# Altium project Lamps_board.PrjPcb
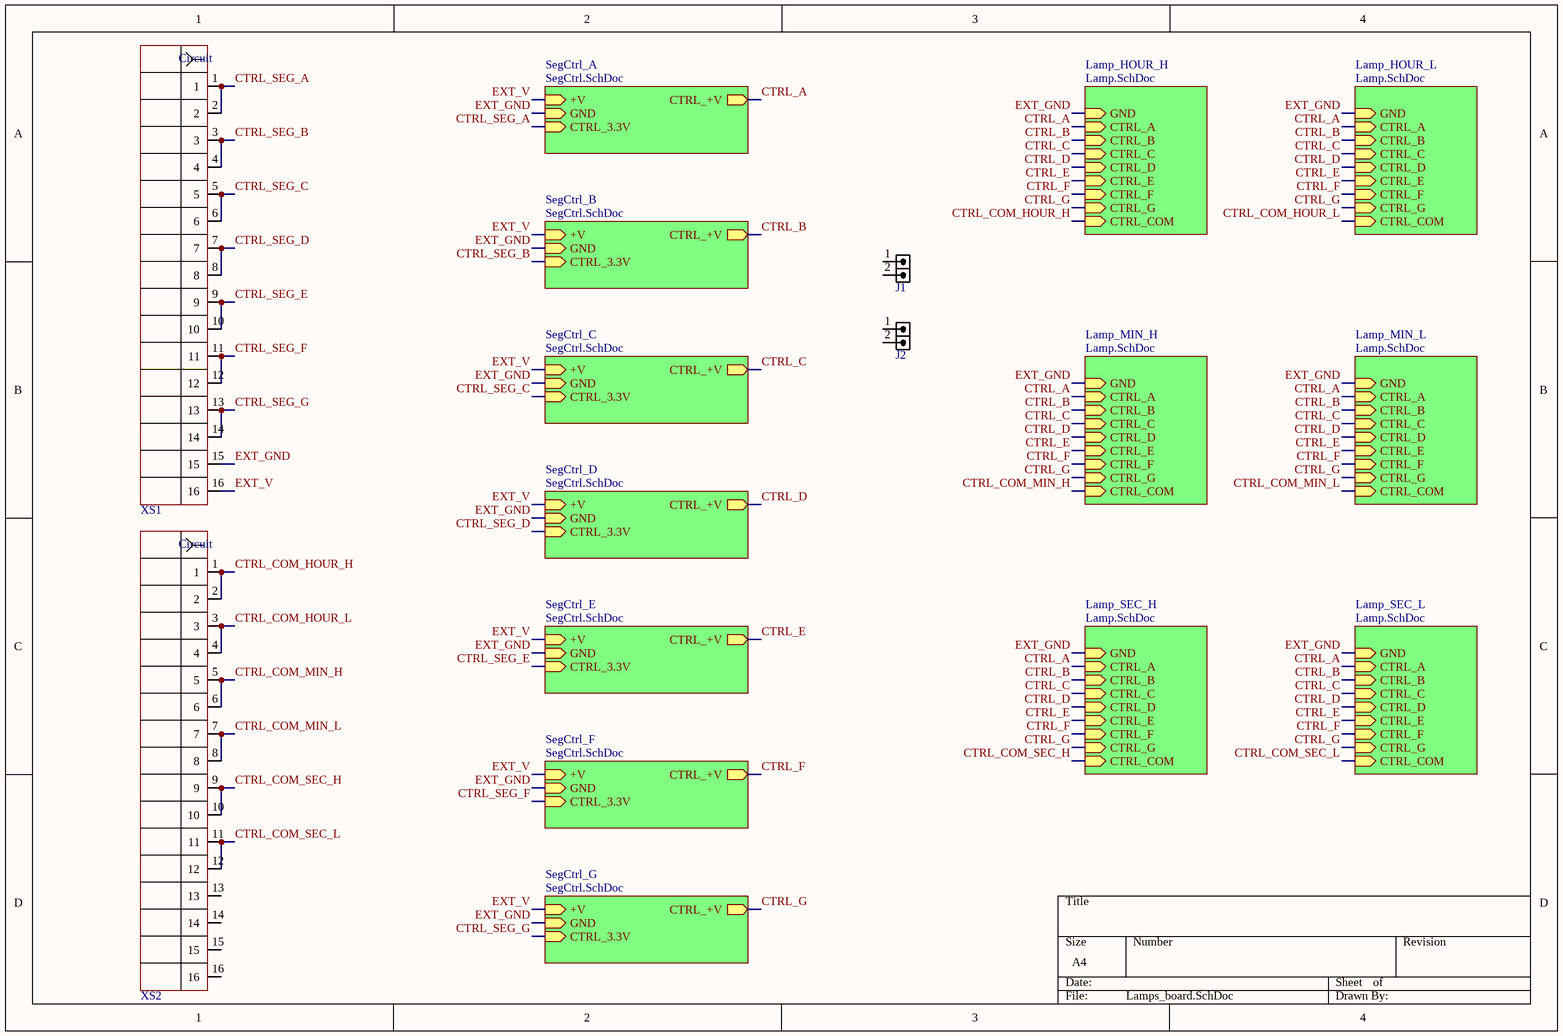
[diagram p0: Lamps_board.SchDoc]
3 sheets, 111 parts. Net scope: hierarchical (ports join the sheet entries above them; power ports are global).
Board file: Lamps_board.PcbDoc
Sheets:
  Lamps_board.SchDoc
    Lamp_HOUR_H = Lamp.SchDoc
    Lamp_HOUR_L = Lamp.SchDoc
    Lamp_MIN_H = Lamp.SchDoc
    Lamp_SEC_L = Lamp.SchDoc
    Lamp_MIN_L = Lamp.SchDoc
    Lamp_SEC_H = Lamp.SchDoc
    SegCtrl_A = SegCtrl.SchDoc
    SegCtrl_B = SegCtrl.SchDoc
    SegCtrl_C = SegCtrl.SchDoc
    SegCtrl_D = SegCtrl.SchDoc
    SegCtrl_E = SegCtrl.SchDoc
    SegCtrl_F = SegCtrl.SchDoc
    SegCtrl_G = SegCtrl.SchDoc

## Sheet Lamps_board.SchDoc
size A4

### Parts
J1  HDRM2  [HDR_M_1X2]  (value not drawn)
J2  HDRM2  [HDR_M_1X2]  (value not drawn)
XS1  PBD-16  [PBD-16-3D]  (value not drawn)
XS2  PBD-16  [PBD-16-3D]  (value not drawn)

### Sub-sheets
Lamp_HOUR_H = Lamp.SchDoc: GND (in), CTRL_A (in), CTRL_B (in), CTRL_C (in), CTRL_D (in), CTRL_E (in), CTRL_F (in), CTRL_G (in), CTRL_COM (in)
Lamp_HOUR_L = Lamp.SchDoc: GND (in), CTRL_A (in), CTRL_B (in), CTRL_C (in), CTRL_D (in), CTRL_E (in), CTRL_F (in), CTRL_G (in), CTRL_COM (in)
Lamp_MIN_H = Lamp.SchDoc: GND (in), CTRL_A (in), CTRL_B (in), CTRL_C (in), CTRL_D (in), CTRL_E (in), CTRL_F (in), CTRL_G (in), CTRL_COM (in)
Lamp_MIN_L = Lamp.SchDoc: GND (in), CTRL_A (in), CTRL_B (in), CTRL_C (in), CTRL_D (in), CTRL_E (in), CTRL_F (in), CTRL_G (in), CTRL_COM (in)
Lamp_SEC_H = Lamp.SchDoc: GND (in), CTRL_A (in), CTRL_B (in), CTRL_C (in), CTRL_D (in), CTRL_E (in), CTRL_F (in), CTRL_G (in), CTRL_COM (in)
Lamp_SEC_L = Lamp.SchDoc: GND (in), CTRL_A (in), CTRL_B (in), CTRL_C (in), CTRL_D (in), CTRL_E (in), CTRL_F (in), CTRL_G (in), CTRL_COM (in)
SegCtrl_A = SegCtrl.SchDoc: +V (in), GND (in), CTRL_3.3V (in), CTRL_+V (out)
SegCtrl_B = SegCtrl.SchDoc: +V (in), GND (in), CTRL_3.3V (in), CTRL_+V (out)
SegCtrl_C = SegCtrl.SchDoc: +V (in), GND (in), CTRL_3.3V (in), CTRL_+V (out)
SegCtrl_D = SegCtrl.SchDoc: +V (in), GND (in), CTRL_3.3V (in), CTRL_+V (out)
SegCtrl_E = SegCtrl.SchDoc: +V (in), GND (in), CTRL_3.3V (in), CTRL_+V (out)
SegCtrl_F = SegCtrl.SchDoc: +V (in), GND (in), CTRL_3.3V (in), CTRL_+V (out)
SegCtrl_G = SegCtrl.SchDoc: +V (in), GND (in), CTRL_3.3V (in), CTRL_+V (out)

### Nets
CTRL_A: sheet Lamp_HOUR_H/CTRL_A, sheet Lamp_HOUR_L/CTRL_A, sheet Lamp_MIN_H/CTRL_A, sheet Lamp_SEC_L/CTRL_A, sheet Lamp_MIN_L/CTRL_A, sheet Lamp_SEC_H/CTRL_A, sheet SegCtrl_A/CTRL_+V
CTRL_B: sheet Lamp_HOUR_H/CTRL_B, sheet Lamp_HOUR_L/CTRL_B, sheet Lamp_MIN_H/CTRL_B, sheet Lamp_SEC_L/CTRL_B, sheet Lamp_MIN_L/CTRL_B, sheet Lamp_SEC_H/CTRL_B, sheet SegCtrl_B/CTRL_+V
CTRL_C: sheet Lamp_HOUR_H/CTRL_C, sheet Lamp_HOUR_L/CTRL_C, sheet Lamp_MIN_H/CTRL_C, sheet Lamp_SEC_L/CTRL_C, sheet Lamp_MIN_L/CTRL_C, sheet Lamp_SEC_H/CTRL_C, sheet SegCtrl_C/CTRL_+V
CTRL_COM_HOUR_H: XS2.1 XS2.2 ; sheet Lamp_HOUR_H/CTRL_COM
CTRL_COM_HOUR_L: XS2.3 XS2.4 ; sheet Lamp_HOUR_L/CTRL_COM
CTRL_COM_MIN_H: XS2.5 XS2.6 ; sheet Lamp_MIN_H/CTRL_COM
CTRL_COM_MIN_L: XS2.7 XS2.8 ; sheet Lamp_MIN_L/CTRL_COM
CTRL_COM_SEC_H: XS2.9 XS2.10 ; sheet Lamp_SEC_H/CTRL_COM
CTRL_COM_SEC_L: XS2.11 XS2.12 ; sheet Lamp_SEC_L/CTRL_COM
CTRL_D: sheet Lamp_HOUR_H/CTRL_D, sheet Lamp_HOUR_L/CTRL_D, sheet Lamp_MIN_H/CTRL_D, sheet Lamp_SEC_L/CTRL_D, sheet Lamp_MIN_L/CTRL_D, sheet Lamp_SEC_H/CTRL_D, sheet SegCtrl_D/CTRL_+V
CTRL_E: sheet Lamp_HOUR_H/CTRL_E, sheet Lamp_HOUR_L/CTRL_E, sheet Lamp_MIN_H/CTRL_E, sheet Lamp_SEC_L/CTRL_E, sheet Lamp_MIN_L/CTRL_E, sheet Lamp_SEC_H/CTRL_E, sheet SegCtrl_E/CTRL_+V
CTRL_F: sheet Lamp_HOUR_H/CTRL_F, sheet Lamp_HOUR_L/CTRL_F, sheet Lamp_MIN_H/CTRL_F, sheet Lamp_SEC_L/CTRL_F, sheet Lamp_MIN_L/CTRL_F, sheet Lamp_SEC_H/CTRL_F, sheet SegCtrl_F/CTRL_+V
CTRL_G: sheet Lamp_HOUR_H/CTRL_G, sheet Lamp_HOUR_L/CTRL_G, sheet Lamp_MIN_H/CTRL_G, sheet Lamp_SEC_L/CTRL_G, sheet Lamp_MIN_L/CTRL_G, sheet Lamp_SEC_H/CTRL_G, sheet SegCtrl_G/CTRL_+V
CTRL_SEG_A: XS1.1 XS1.2 ; sheet SegCtrl_A/CTRL_3.3V
CTRL_SEG_B: XS1.3 XS1.4 ; sheet SegCtrl_B/CTRL_3.3V
CTRL_SEG_C: XS1.5 XS1.6 ; sheet SegCtrl_C/CTRL_3.3V
CTRL_SEG_D: XS1.7 XS1.8 ; sheet SegCtrl_D/CTRL_3.3V
CTRL_SEG_E: XS1.9 XS1.10 ; sheet SegCtrl_E/CTRL_3.3V
CTRL_SEG_F: XS1.11 XS1.12 ; sheet SegCtrl_F/CTRL_3.3V
CTRL_SEG_G: XS1.13 XS1.14 ; sheet SegCtrl_G/CTRL_3.3V
EXT_GND: XS1.15 ; sheet Lamp_HOUR_H/GND, sheet Lamp_HOUR_L/GND, sheet Lamp_MIN_H/GND, sheet Lamp_SEC_L/GND, sheet Lamp_MIN_L/GND, sheet Lamp_SEC_H/GND, sheet SegCtrl_A/GND, sheet SegCtrl_B/GND, sheet SegCtrl_C/GND, sheet SegCtrl_D/GND, sheet SegCtrl_E/GND, sheet SegCtrl_F/GND, sheet SegCtrl_G/GND
EXT_V: XS1.16 ; sheet SegCtrl_A/+V, sheet SegCtrl_B/+V, sheet SegCtrl_C/+V, sheet SegCtrl_D/+V, sheet SegCtrl_E/+V, sheet SegCtrl_F/+V, sheet SegCtrl_G/+V

Not connected (* = marked no-connect by the designer): J1 1 2; J2 1 2; XS2 13 14 15 16

### Notes on the sheet
- (in symbol SH2-16G) Circuit

### Library data of the parts
J1 J2 = HDR_M_1X2: CONN, HEADER, Male, pitch: 2.54mm, 2POS; VALUE: HDRM2
XS1 XS2 = SH2-16G: CONN RCPT 16POS 0.1 GOLD PCB; System: Connector; Part Number: SH2-16G; Manufacturer Part Number: SH2-16G; Digi-Key Part Number: ED3071-ND; Price$: 0.20250; Package: Socket 16POS 2.54mm; HelpURL: https://www.digikey.com/en/products/detail/on-shore-technology-inc/SH2-16G/2721215

## Sheet Lamp.SchDoc
size A4
Used 6 times, as channels Lamp_HOUR_H, Lamp_HOUR_L, Lamp_MIN_H, Lamp_SEC_L, Lamp_MIN_L, Lamp_SEC_H. Parts and nets are listed once, with the designators drawn on the sheet.
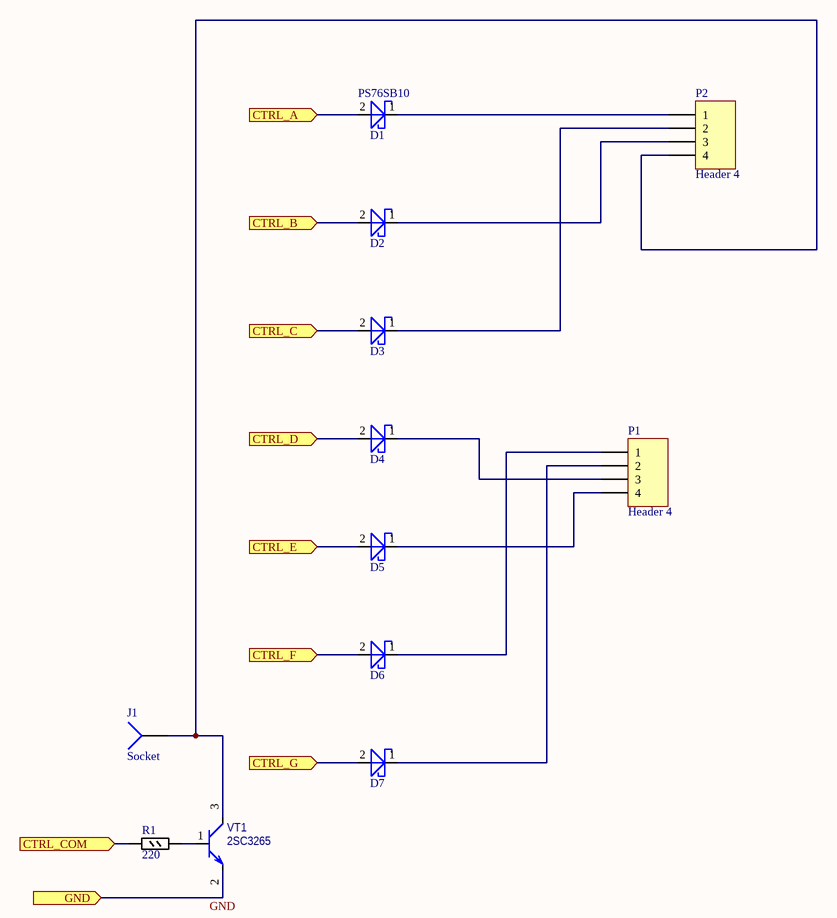
[diagram p1: Lamp.SchDoc]

### Parts
D1  PS76SB10  [SOD2512X115N]
D2  1A 20V  [SOD2512X115N]  (value not drawn)
D3  1A 20V  [SOD2512X115N]  (value not drawn)
D4  1A 20V  [SOD2512X115N]  (value not drawn)
D5  1A 20V  [SOD2512X115N]  (value not drawn)
D6  1A 20V  [SOD2512X115N]  (value not drawn)
D7  1A 20V  [SOD2512X115N]  (value not drawn)
J1  Socket  [PIN1]
P1  Header 4  [HDR1X4]
P2  Header 4  [HDR1X4]
R1  220  [RESC2012(0805)N]
VT1  2SC3265  [SOT23-3N]

### Ports
CTRL_A (in), CTRL_B (in), CTRL_C (in), CTRL_COM (in), CTRL_D (in), CTRL_E (in), CTRL_F (in), CTRL_G (in), GND (in)

### Nets
CTRL_A: D1.2(A) ; port CTRL_A
CTRL_B: D2.2(A) ; port CTRL_B
CTRL_C: D3.2(A) ; port CTRL_C
CTRL_COM: R1.1 ; port CTRL_COM
CTRL_D: D4.2(A) ; port CTRL_D
CTRL_E: D5.2(A) ; port CTRL_E
CTRL_F: D6.2(A) ; port CTRL_F
CTRL_G: D7.2(A) ; port CTRL_G
GND: VT1.2(E) ; port GND
NetD1_1: D1.1(K) P2.1
NetD2_1: D2.1(K) P2.3
NetD3_1: D3.1(K) P2.2
NetD4_1: D4.1(K) P1.3
NetD5_1: D5.1(K) P1.4
NetD6_1: D6.1(K) P1.1
NetD7_1: D7.1(K) P1.2
NetJ1_1: J1.1 P2.4 VT1.3(C)
NetR1_2: R1.2 VT1.1(B)

### Channels
Lamp_HOUR_H: designators end in _Lamp_HOUR_H; ports CTRL_A=CTRL_A CTRL_B=CTRL_B CTRL_C=CTRL_C CTRL_COM=CTRL_COM_HOUR_H CTRL_D=CTRL_D CTRL_E=CTRL_E CTRL_F=CTRL_F CTRL_G=CTRL_G GND=EXT_GND
Lamp_HOUR_L: designators end in _Lamp_HOUR_L; ports CTRL_A=CTRL_A CTRL_B=CTRL_B CTRL_C=CTRL_C CTRL_COM=CTRL_COM_HOUR_L CTRL_D=CTRL_D CTRL_E=CTRL_E CTRL_F=CTRL_F CTRL_G=CTRL_G GND=EXT_GND
Lamp_MIN_H: designators end in _Lamp_MIN_H; ports CTRL_A=CTRL_A CTRL_B=CTRL_B CTRL_C=CTRL_C CTRL_COM=CTRL_COM_MIN_H CTRL_D=CTRL_D CTRL_E=CTRL_E CTRL_F=CTRL_F CTRL_G=CTRL_G GND=EXT_GND
Lamp_SEC_L: designators end in _Lamp_SEC_L; ports CTRL_A=CTRL_A CTRL_B=CTRL_B CTRL_C=CTRL_C CTRL_COM=CTRL_COM_SEC_L CTRL_D=CTRL_D CTRL_E=CTRL_E CTRL_F=CTRL_F CTRL_G=CTRL_G GND=EXT_GND
Lamp_MIN_L: designators end in _Lamp_MIN_L; ports CTRL_A=CTRL_A CTRL_B=CTRL_B CTRL_C=CTRL_C CTRL_COM=CTRL_COM_MIN_L CTRL_D=CTRL_D CTRL_E=CTRL_E CTRL_F=CTRL_F CTRL_G=CTRL_G GND=EXT_GND
Lamp_SEC_H: designators end in _Lamp_SEC_H; ports CTRL_A=CTRL_A CTRL_B=CTRL_B CTRL_C=CTRL_C CTRL_COM=CTRL_COM_SEC_H CTRL_D=CTRL_D CTRL_E=CTRL_E CTRL_F=CTRL_F CTRL_G=CTRL_G GND=EXT_GND

### Library data of the parts
D1-D7 = B5817WS: DIODE SCHOTTKY 20V 1A SOD323; Part Number: B5817WS; HelpURL: https://www.digikey.com/en/products/detail/yangzhou-yangjie-electronic-technology-co-ltd/B5817WS/13911879; Digi-Key Part Number: 3191-B5817WSCT-ND; Manufacturer Part Number: B5817WS; Package: SOD-323
P1 P2 = Header 4: Header, 4-Pin; LatestRevisionDate: 17-Jul-2002; LatestRevisionNote: Re-released for DXP Platform.; Publisher: Altium Limited
R1 = RESC2012(0805): Part Number: RESC2012(0805); Package: 0805
VT1 = BC848: Part Number: BC848; HelpURL: http://www.nxp.com/documents/data_sheet/BC848_SER.pdf
J1 = Socket: LatestRevisionDate: 17-Jul-2002; LatestRevisionNote: Re-released for DXP Platform.; Publisher: Altium Limited

## Sheet SegCtrl.SchDoc
size A4
Used 7 times, as channels SegCtrl_A, SegCtrl_B, SegCtrl_C, SegCtrl_D, SegCtrl_E, SegCtrl_F, SegCtrl_G. Parts and nets are listed once, with the designators drawn on the sheet.
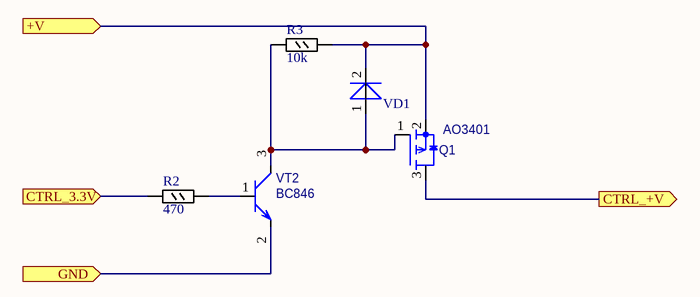
[diagram p2: SegCtrl.SchDoc]

### Parts
Q1  AO3401  [SOT23-3N]
R2  470  [RESC2012(0805)N]
R3  10k  [RESC2012(0805)N]
VD1  1A 40V  [SMA]  (value not drawn)
VT2  BC846  [SOT23-3N]

### Ports
+V (in), CTRL_3.3V (in), CTRL_+V (out), GND (in)

### Nets
+V: Q1.2(S) R3.2 VD1.2 ; port +V
CTRL_3.3V: R2.1 ; port CTRL_3.3V
CTRL_+V: Q1.3(D) ; port CTRL_+V
GND: VT2.2(E) ; port GND
NetQ1_1: Q1.1(G) R3.1 VD1.1 VT2.3(C)
NetR2_2: R2.2 VT2.1(B)

### Channels
SegCtrl_A: designators end in _SegCtrl_A; ports +V=EXT_V CTRL_3.3V=CTRL_SEG_A CTRL_+V=CTRL_A GND=EXT_GND
SegCtrl_B: designators end in _SegCtrl_B; ports +V=EXT_V CTRL_3.3V=CTRL_SEG_B CTRL_+V=CTRL_B GND=EXT_GND
SegCtrl_C: designators end in _SegCtrl_C; ports +V=EXT_V CTRL_3.3V=CTRL_SEG_C CTRL_+V=CTRL_C GND=EXT_GND
SegCtrl_D: designators end in _SegCtrl_D; ports +V=EXT_V CTRL_3.3V=CTRL_SEG_D CTRL_+V=CTRL_D GND=EXT_GND
SegCtrl_E: designators end in _SegCtrl_E; ports +V=EXT_V CTRL_3.3V=CTRL_SEG_E CTRL_+V=CTRL_E GND=EXT_GND
SegCtrl_F: designators end in _SegCtrl_F; ports +V=EXT_V CTRL_3.3V=CTRL_SEG_F CTRL_+V=CTRL_F GND=EXT_GND
SegCtrl_G: designators end in _SegCtrl_G; ports +V=EXT_V CTRL_3.3V=CTRL_SEG_G CTRL_+V=CTRL_G GND=EXT_GND

### Library data of the parts
Q1 = DMP10H4D2S-7: MOSFET P-CH 100V 270MA SOT23; Part Number: DMP10H4D2S-7; Package: DMP10H4D2S-7
R2 R3 = RESC2012(0805): Part Number: RESC2012(0805); Package: 0805
VD1 = SS14: Диод Шоттки 1A 40В [SMA / DO-214AC]; Part Number: SS14; HelpURL: http://www.vishay.com/docs/88746/ss12.pdf
VT2 = BC848: Part Number: BC848; HelpURL: http://www.nxp.com/documents/data_sheet/BC848_SER.pdf

## Nets that join several sheets
CTRL_A: Lamp_HOUR_H (D1_Lamp_HOUR_H.2), Lamp_HOUR_L (D1_Lamp_HOUR_L.2), Lamp_MIN_H (D1_Lamp_MIN_H.2), Lamp_SEC_L (D1_Lamp_SEC_L.2), Lamp_MIN_L (D1_Lamp_MIN_L.2), Lamp_SEC_H (D1_Lamp_SEC_H.2), SegCtrl_A (Q1_SegCtrl_A.3)
CTRL_B: Lamp_HOUR_H (D2_Lamp_HOUR_H.2), Lamp_HOUR_L (D2_Lamp_HOUR_L.2), Lamp_MIN_H (D2_Lamp_MIN_H.2), Lamp_SEC_L (D2_Lamp_SEC_L.2), Lamp_MIN_L (D2_Lamp_MIN_L.2), Lamp_SEC_H (D2_Lamp_SEC_H.2), SegCtrl_B (Q1_SegCtrl_B.3)
CTRL_C: Lamp_HOUR_H (D3_Lamp_HOUR_H.2), Lamp_HOUR_L (D3_Lamp_HOUR_L.2), Lamp_MIN_H (D3_Lamp_MIN_H.2), Lamp_SEC_L (D3_Lamp_SEC_L.2), Lamp_MIN_L (D3_Lamp_MIN_L.2), Lamp_SEC_H (D3_Lamp_SEC_H.2), SegCtrl_C (Q1_SegCtrl_C.3)
CTRL_COM_HOUR_H: Lamps_board (XS2.1 XS2.2), Lamp_HOUR_H (R1_Lamp_HOUR_H.1)
CTRL_COM_HOUR_L: Lamps_board (XS2.3 XS2.4), Lamp_HOUR_L (R1_Lamp_HOUR_L.1)
CTRL_COM_MIN_H: Lamps_board (XS2.5 XS2.6), Lamp_MIN_H (R1_Lamp_MIN_H.1)
CTRL_COM_MIN_L: Lamps_board (XS2.7 XS2.8), Lamp_MIN_L (R1_Lamp_MIN_L.1)
CTRL_COM_SEC_H: Lamps_board (XS2.9 XS2.10), Lamp_SEC_H (R1_Lamp_SEC_H.1)
CTRL_COM_SEC_L: Lamps_board (XS2.11 XS2.12), Lamp_SEC_L (R1_Lamp_SEC_L.1)
CTRL_D: Lamp_HOUR_H (D4_Lamp_HOUR_H.2), Lamp_HOUR_L (D4_Lamp_HOUR_L.2), Lamp_MIN_H (D4_Lamp_MIN_H.2), Lamp_SEC_L (D4_Lamp_SEC_L.2), Lamp_MIN_L (D4_Lamp_MIN_L.2), Lamp_SEC_H (D4_Lamp_SEC_H.2), SegCtrl_D (Q1_SegCtrl_D.3)
CTRL_E: Lamp_HOUR_H (D5_Lamp_HOUR_H.2), Lamp_HOUR_L (D5_Lamp_HOUR_L.2), Lamp_MIN_H (D5_Lamp_MIN_H.2), Lamp_SEC_L (D5_Lamp_SEC_L.2), Lamp_MIN_L (D5_Lamp_MIN_L.2), Lamp_SEC_H (D5_Lamp_SEC_H.2), SegCtrl_E (Q1_SegCtrl_E.3)
CTRL_F: Lamp_HOUR_H (D6_Lamp_HOUR_H.2), Lamp_HOUR_L (D6_Lamp_HOUR_L.2), Lamp_MIN_H (D6_Lamp_MIN_H.2), Lamp_SEC_L (D6_Lamp_SEC_L.2), Lamp_MIN_L (D6_Lamp_MIN_L.2), Lamp_SEC_H (D6_Lamp_SEC_H.2), SegCtrl_F (Q1_SegCtrl_F.3)
CTRL_G: Lamp_HOUR_H (D7_Lamp_HOUR_H.2), Lamp_HOUR_L (D7_Lamp_HOUR_L.2), Lamp_MIN_H (D7_Lamp_MIN_H.2), Lamp_SEC_L (D7_Lamp_SEC_L.2), Lamp_MIN_L (D7_Lamp_MIN_L.2), Lamp_SEC_H (D7_Lamp_SEC_H.2), SegCtrl_G (Q1_SegCtrl_G.3)
CTRL_SEG_A: Lamps_board (XS1.1 XS1.2), SegCtrl_A (R2_SegCtrl_A.1)
CTRL_SEG_B: Lamps_board (XS1.3 XS1.4), SegCtrl_B (R2_SegCtrl_B.1)
CTRL_SEG_C: Lamps_board (XS1.5 XS1.6), SegCtrl_C (R2_SegCtrl_C.1)
CTRL_SEG_D: Lamps_board (XS1.7 XS1.8), SegCtrl_D (R2_SegCtrl_D.1)
CTRL_SEG_E: Lamps_board (XS1.9 XS1.10), SegCtrl_E (R2_SegCtrl_E.1)
CTRL_SEG_F: Lamps_board (XS1.11 XS1.12), SegCtrl_F (R2_SegCtrl_F.1)
CTRL_SEG_G: Lamps_board (XS1.13 XS1.14), SegCtrl_G (R2_SegCtrl_G.1)
EXT_GND: Lamps_board (XS1.15), Lamp_HOUR_H (VT1_Lamp_HOUR_H.2), Lamp_HOUR_L (VT1_Lamp_HOUR_L.2), Lamp_MIN_H (VT1_Lamp_MIN_H.2), Lamp_SEC_L (VT1_Lamp_SEC_L.2), Lamp_MIN_L (VT1_Lamp_MIN_L.2), Lamp_SEC_H (VT1_Lamp_SEC_H.2), SegCtrl_A (VT2_SegCtrl_A.2), SegCtrl_B (VT2_SegCtrl_B.2), SegCtrl_C (VT2_SegCtrl_C.2), SegCtrl_D (VT2_SegCtrl_D.2), SegCtrl_E (VT2_SegCtrl_E.2), SegCtrl_F (VT2_SegCtrl_F.2), SegCtrl_G (VT2_SegCtrl_G.2)
EXT_V: Lamps_board (XS1.16), SegCtrl_A (Q1_SegCtrl_A.2 R3_SegCtrl_A.2 VD1_SegCtrl_A.2), SegCtrl_B (Q1_SegCtrl_B.2 R3_SegCtrl_B.2 VD1_SegCtrl_B.2), SegCtrl_C (Q1_SegCtrl_C.2 R3_SegCtrl_C.2 VD1_SegCtrl_C.2), SegCtrl_D (Q1_SegCtrl_D.2 R3_SegCtrl_D.2 VD1_SegCtrl_D.2), SegCtrl_E (Q1_SegCtrl_E.2 R3_SegCtrl_E.2 VD1_SegCtrl_E.2), SegCtrl_F (Q1_SegCtrl_F.2 R3_SegCtrl_F.2 VD1_SegCtrl_F.2), SegCtrl_G (Q1_SegCtrl_G.2 R3_SegCtrl_G.2 VD1_SegCtrl_G.2)